# Altium project Turret_PCB.PrjPcb
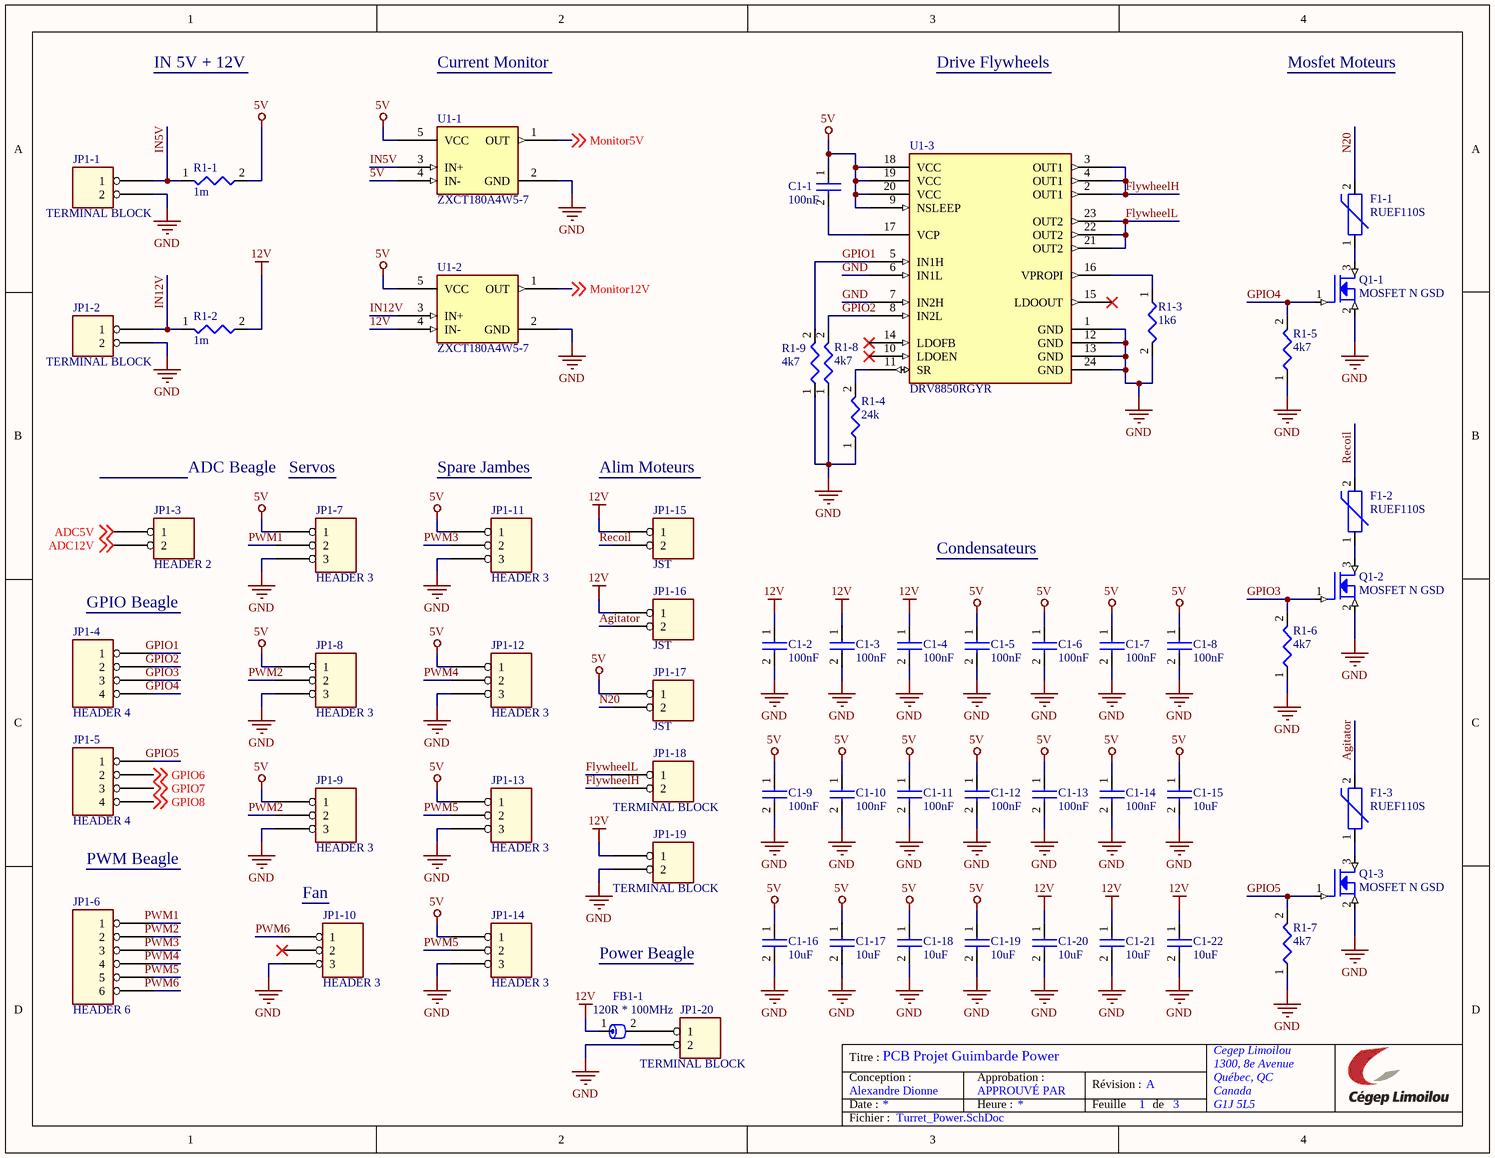
[diagram p0: Turret_Power.SchDoc]
NomDeProjet: Mon Projet; Revision: Rev.C
3 sheets, 100 parts. Net scope: global (net labels, ports and power ports of the same name join across sheets).
Board file: Turret.PcbDoc
Sheets:
  Turret_Power.SchDoc
  Turret_ADC_Protection.SchDoc
  Turret_Logic.SchDoc

## Sheet Turret_Power.SchDoc: PCB Projet Guimbarde Power
size Letter; ApprovedBy: APPROUVÉ PAR; Author: Alexandre Dionne; Organization: Cegep Limoilou; Address1: 1300, 8e Avenue; Address2: Québec, QC; Address3: Canada; Address4: G1J 5L5; Revision: A; SheetNumber: 1; SheetTotal: 3

### Parts
C1-1  100nF  [CAP_0603]
C1-2  100nF  [CAP_0603]
C1-3  100nF  [CAP_0603]
C1-4  100nF  [CAP_0603]
C1-5  100nF  [CAP_0603]
C1-6  100nF  [CAP_0603]
C1-7  100nF  [CAP_0603]
C1-8  100nF  [CAP_0603]
C1-9  100nF  [CAP_0603]
C1-10  100nF  [CAP_0603]
C1-11  100nF  [CAP_0603]
C1-12  100nF  [CAP_0603]
C1-13  100nF  [CAP_0603]
C1-14  100nF  [CAP_0603]
C1-15  10uF  [CAP_0603]
C1-16  10uF  [CAP_0603]
C1-17  10uF  [CAP_0603]
C1-18  10uF  [CAP_0603]
C1-19  10uF  [CAP_0603]
C1-20  10uF  [CAP_0603]
C1-21  10uF  [CAP_0603]
C1-22  10uF  [CAP_0603]
F1-1  RUEF110S  [MINISMDC110F/24-2]
F1-2  RUEF110S  [MINISMDC110F/24-2]
F1-3  RUEF110S  [MINISMDC110F/24-2]
FB1-1  120R * 100MHz  [MFBM1V3216-121-R]
JP1-1  TERMINAL BLOCK  [TB005-762-02BE]
JP1-2  TERMINAL BLOCK  [TB005-762-02BE]
JP1-3  HEADER 2  [Header_2]
JP1-4  HEADER 4  [Header_4]
JP1-5  HEADER 4  [Header_4]
JP1-6  HEADER 6  [Header_6]
JP1-7  HEADER 3  [Header_3]
JP1-8  HEADER 3  [Header_3]
JP1-9  HEADER 3  [Header_3]
JP1-10  HEADER 3  [Header_3]
JP1-11  HEADER 3  [Header_3]
JP1-12  HEADER 3  [Header_3]
JP1-13  HEADER 3  [Header_3]
JP1-14  HEADER 3  [Header_3]
JP1-15  JST  [B2B-PH-K-S]
JP1-16  JST  [B2B-PH-K-S]
JP1-17  JST  [B2B-PH-K-S]
JP1-18  TERMINAL BLOCK  [TB005-762-02BE]
JP1-19  TERMINAL BLOCK  [TB005-762-02BE]
JP1-20  TERMINAL BLOCK  [TB005-762-02BE]
Q1-1  MOSFET N GSD  [GSFC2312]
Q1-2  MOSFET N GSD  [GSFC2312]
Q1-3  MOSFET N GSD  [GSFC2312]
R1-1  1m  [RES_1206]
R1-2  1m  [RES_1206]
R1-3  1k6  [RES_0603]
R1-4  24k  [RES_0603]
R1-5  4k7  [RES_0603]
R1-6  4k7  [RES_0603]
R1-7  4k7  [RES_0603]
R1-8  4k7  [RES_0603]
R1-9  4k7  [RES_0603]
U1-1  ZXCT180A4W5-7  [ZXCT180A4W5-7]
U1-2  ZXCT180A4W5-7  [ZXCT180A4W5-7]
U1-3  DRV8850RGYR  [DRV8850]

### Nets
5V: C1-1.1 C1-5.1 C1-6.1 C1-7.1 C1-8.1 C1-9.1 C1-10.1 C1-11.1 C1-12.1 C1-13.1 C1-14.1 C1-15.1 C1-16.1 C1-17.1 C1-18.1 C1-19.1 JP1-7.1 JP1-8.1 JP1-9.1 JP1-11.1 JP1-12.1 JP1-13.1 JP1-14.1 JP1-17.1 R1-1.2 U1-1.4(IN-) U1-1.5(VCC) U1-2.5(VCC) U1-3.9(NSLEEP) U1-3.18(VCC) U1-3.19(VCC) U1-3.20(VCC)
12V: C1-2.1 C1-3.1 C1-4.1 C1-20.1 C1-21.1 C1-22.1 FB1-1.1 JP1-15.1 JP1-16.1 JP1-19.1 R1-2.2 U1-2.4(IN-)
GND: C1-2.2 C1-3.2 C1-4.2 C1-5.2 C1-6.2 C1-7.2 C1-8.2 C1-9.2 C1-10.2 C1-11.2 C1-12.2 C1-13.2 C1-14.2 C1-15.2 C1-16.2 C1-17.2 C1-18.2 C1-19.2 C1-20.2 C1-21.2 C1-22.2 JP1-1.2 JP1-2.2 JP1-7.3 JP1-8.3 JP1-9.3 JP1-10.3 JP1-11.3 JP1-12.3 JP1-13.3 JP1-14.3 JP1-19.2 JP1-20.2 Q1-1.2(SOURCE) Q1-2.2(SOURCE) Q1-3.2(SOURCE) R1-3.2 R1-4.1 R1-5.1 R1-6.1 R1-7.1 R1-8.1 R1-9.1 U1-1.2(GND) U1-2.2(GND) U1-3.1(GND) U1-3.6(IN1L) U1-3.7(IN2H) U1-3.12(GND) U1-3.13(GND) U1-3.24(GND)
ADC5V: JP1-3.1 ; off-sheet ADC5V
ADC12V: JP1-3.2 ; off-sheet ADC12V
Agitator: F1-3.2 JP1-16.2
FlywheelH: JP1-18.2 U1-3.2(OUT1) U1-3.3(OUT1) U1-3.4(OUT1)
FlywheelL: JP1-18.1 U1-3.21(OUT2) U1-3.22(OUT2) U1-3.23(OUT2)
GPIO1: JP1-4.1 R1-9.2 U1-3.5(IN1H)
GPIO2: JP1-4.2 R1-8.2 U1-3.8(IN2L)
GPIO3: JP1-4.3 Q1-2.1(GATE) R1-6.2
GPIO4: JP1-4.4 Q1-1.1(GATE) R1-5.2
GPIO5: JP1-5.1 Q1-3.1(GATE) R1-7.2
GPIO6: JP1-5.2 ; off-sheet GPIO6
GPIO7: JP1-5.3 ; off-sheet GPIO7
GPIO8: JP1-5.4 ; off-sheet GPIO8
IN5V: JP1-1.1 R1-1.1 U1-1.3(IN+)
IN12V: JP1-2.1 R1-2.1 U1-2.3(IN+)
Monitor5V: U1-1.1(OUT) ; off-sheet Monitor5V
Monitor12V: U1-2.1(OUT) ; off-sheet Monitor12V
N20: F1-1.2 JP1-17.2
PWM1: JP1-6.1 JP1-7.2
PWM2: JP1-6.2 JP1-8.2 JP1-9.2
PWM3: JP1-6.3 JP1-11.2
PWM4: JP1-6.4 JP1-12.2
PWM5: JP1-6.5 JP1-13.2 JP1-14.2
PWM6: JP1-6.6 JP1-10.1
Recoil: F1-2.2 JP1-15.2
NetC1-1_2: C1-1.2 U1-3.17(VCP)
NetF1-1_1: F1-1.1 Q1-1.3(DRAIN)
NetF1-2_1: F1-2.1 Q1-2.3(DRAIN)
NetF1-3_1: F1-3.1 Q1-3.3(DRAIN)
NetFB1-1_2: FB1-1.2 JP1-20.1
NetR1-3_1: R1-3.1 U1-3.16(VPROPI)
NetR1-4_2: R1-4.2 U1-3.11(SR)

Not connected (* = marked no-connect by the designer): JP1-10 2*; U1-3 10(LDOEN)* 14(LDOFB)* 15(LDOOUT)*

### Notes on the sheet
- IN 5V + 12V
- Current Monitor
- Drive Flywheels
- Mosfet Moteurs
- ADC Beagle
- Servos
- Spare Jambes
- Alim Moteurs
- Condensateurs
- GPIO Beagle
- PWM Beagle
- (near JP1-10) Fan
- Power Beagle
- Titre :
- Conception :
- Date :
- Approbation :
- Heure :
- Révision :
- Feuille
- de
- Fichier :

### Library data of the parts
C1-1-C1-22 = CAP NP
F1-1-F1-3 = Polyswitch
FB1-1 = Ferrite
JP1-1 JP1-2 JP1-15-JP1-20 = HEADER 2
R1-1-R1-9 = R
U1-3 = DRV8850RGYR: No Description Available; Mfr_Name: Texas Instruments; RefDes: RefDes; Type: Type

## Sheet Turret_ADC_Protection.SchDoc: Protection ADC
size Letter; ApprovedBy: APPROUVÉ PAR; Author: Alexandre Dionne; Organization: Cegep Limoilou; Address1: 1300, 8e Avenue; Address2: Québec, QC; Address3: Canada; Address4: G1J 5L5; Revision: A; SheetNumber: 2; SheetTotal: 3
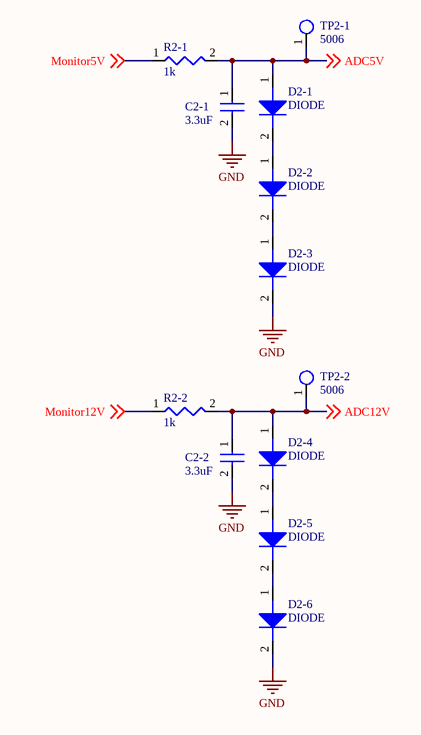
[diagram p1: Turret_ADC_Protection.SchDoc]

### Parts
C2-1  3.3uF  [CAP_0603]
C2-2  3.3uF  [CAP_0603]
D2-1  DIODE  [CD214A-B160R]
D2-2  DIODE  [CD214A-B160R]
D2-3  DIODE  [CD214A-B160R]
D2-4  DIODE  [CD214A-B160R]
D2-5  DIODE  [CD214A-B160R]
D2-6  DIODE  [CD214A-B160R]
R2-1  1k  [RES_0603]
R2-2  1k  [RES_0603]
TP2-1  5006  [TestPoint]
TP2-2  5006  [TestPoint]

### Nets
GND: C2-1.2 C2-2.2 D2-3.2(CATHODE) D2-6.2(CATHODE)
ADC5V: C2-1.1 D2-1.1(ANODE) R2-1.2 TP2-1.1 ; off-sheet ADC5V
ADC12V: C2-2.1 D2-4.1(ANODE) R2-2.2 TP2-2.1 ; off-sheet ADC12V
Monitor5V: R2-1.1 ; off-sheet Monitor5V
Monitor12V: R2-2.1 ; off-sheet Monitor12V
NetD2-1_2: D2-1.2(CATHODE) D2-2.1(ANODE)
NetD2-2_2: D2-2.2(CATHODE) D2-3.1(ANODE)
NetD2-4_2: D2-4.2(CATHODE) D2-5.1(ANODE)
NetD2-5_2: D2-5.2(CATHODE) D2-6.1(ANODE)

### Notes on the sheet
- Titre :
- Conception :
- Date :
- Approbation :
- Heure :
- Révision :
- Feuille
- de
- Fichier :

### Library data of the parts
C2-1 C2-2 = CAP NP
R2-1 R2-2 = R
TP2-1 TP2-2 = Test_Point

## Sheet Turret_Logic.SchDoc: PCB Projet Guimbarde Logic
size Letter; ApprovedBy: APPROUVÉ PAR; Author: Alexandre Dionne; Organization: Cegep Limoilou; Address1: 1300, 8e Avenue; Address2: Québec, QC; Address3: Canada; Address4: G1J 5L5; Revision: A; SheetNumber: 3; SheetTotal: 3
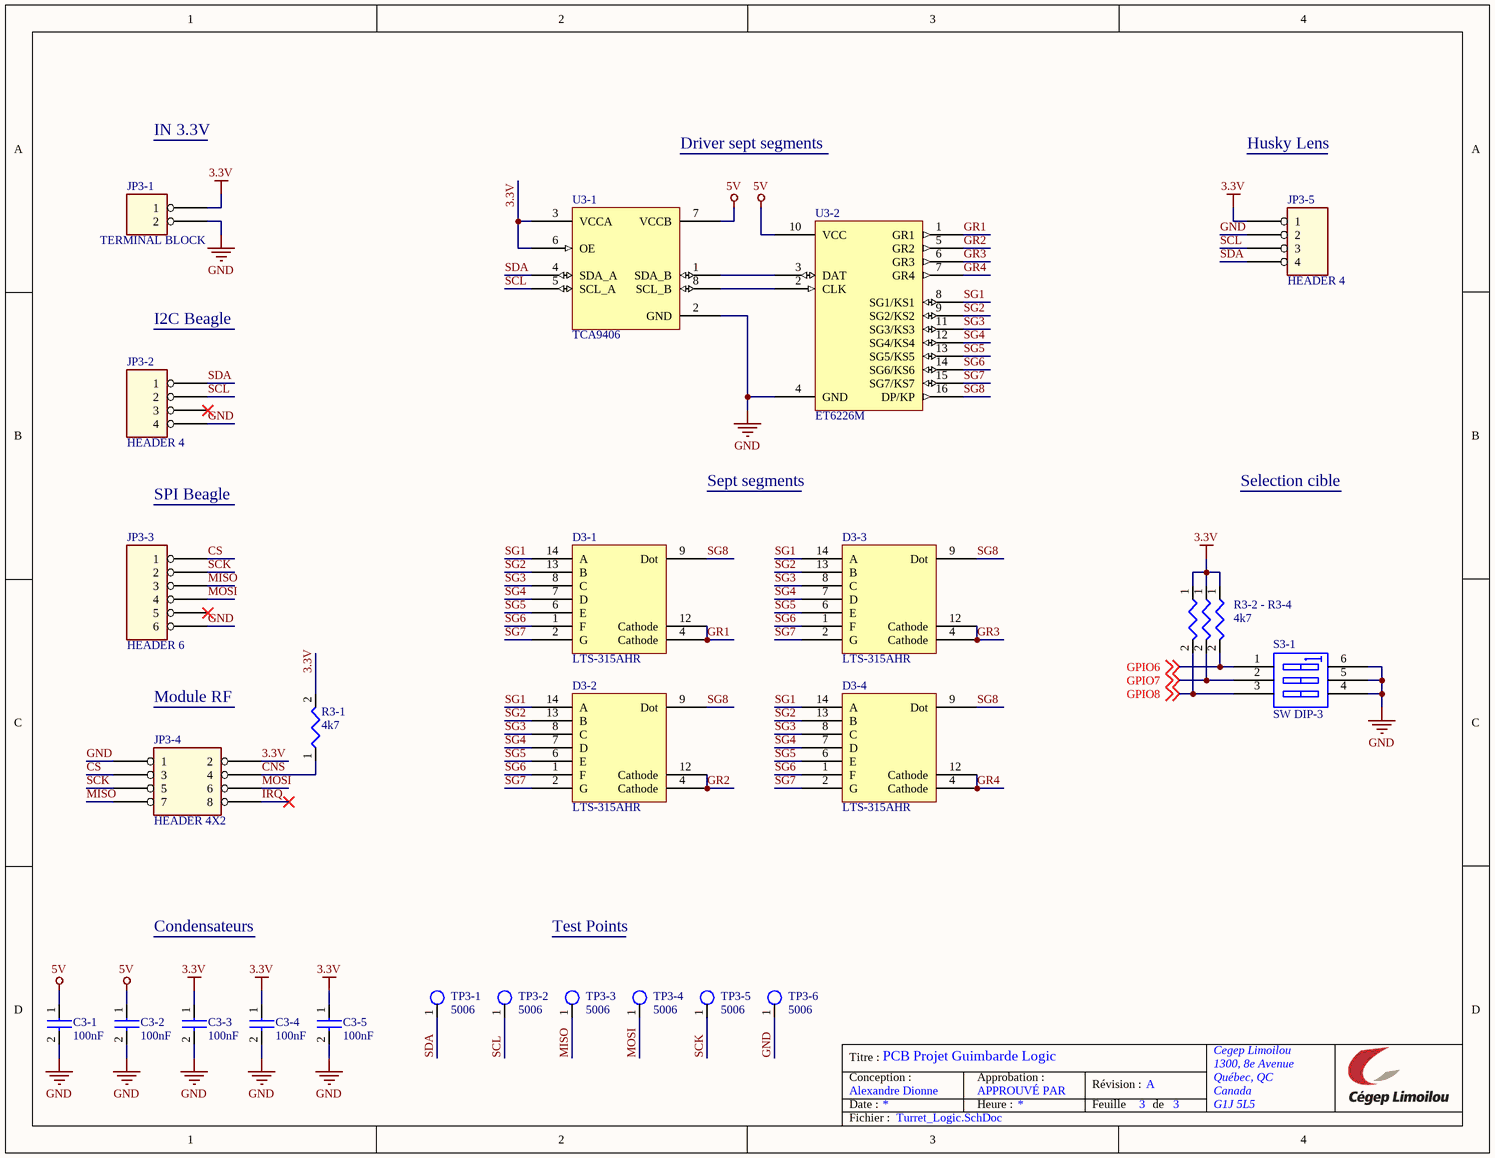
[diagram p2: Turret_Logic.SchDoc]

### Parts
C3-1  100nF  [CAP_0603]
C3-2  100nF  [CAP_0603]
C3-3  100nF  [CAP_0603]
C3-4  100nF  [CAP_0603]
C3-5  100nF  [CAP_0603]
D3-1  LTS-315AHR  [LTS-315AHR]
D3-2  LTS-315AHR  [LTS-315AHR]
D3-3  LTS-315AHR  [LTS-315AHR]
D3-4  LTS-315AHR  [LTS-315AHR]
JP3-1  TERMINAL BLOCK  [TB005-762-02BE]
JP3-2  HEADER 4  [Header_4]
JP3-3  HEADER 6  [Header_6]
JP3-4  HEADER 4X2  [Header_2x4]
JP3-5  HEADER 4  [Header_4]
R3-1  4k7  [RES_0603]
R3-2  4k7  [RES_0603]  (value not drawn)
R3-3  4k7  [RES_0603]  (value not drawn)
R3-4  4k7  [RES_0603]  (value not drawn)
S3-1  SW DIP-3  [219-3LPST]
TP3-1  5006  [TestPoint]
TP3-2  5006  [TestPoint]
TP3-3  5006  [TestPoint]
TP3-4  5006  [TestPoint]
TP3-5  5006  [TestPoint]
TP3-6  5006  [TestPoint]
U3-1  TCA9406  [TCA9406]
U3-2  ET6226M  [ET6226M]

### Nets
3.3V: C3-3.1 C3-4.1 C3-5.1 JP3-1.1 JP3-4.2 JP3-5.1 R3-1.2 R3-2.1 R3-3.1 R3-4.1 U3-1.3(VCCA) U3-1.6(OE)
5V: C3-1.1 C3-2.1 U3-1.7(VCCB) U3-2.10(VCC)
GND: C3-1.2 C3-2.2 C3-3.2 C3-4.2 C3-5.2 JP3-1.2 JP3-2.4 JP3-3.6 JP3-4.1 JP3-5.2 S3-1.4(B3) S3-1.5(B2) S3-1.6(B1) TP3-6.1 U3-1.2(GND) U3-2.4(GND)
CNS: JP3-4.4 R3-1.1
CS: JP3-3.1 JP3-4.3
GPIO6: R3-4.2 S3-1.1(A1) ; off-sheet GPIO6
GPIO7: R3-3.2 S3-1.2(A2) ; off-sheet GPIO7
GPIO8: R3-2.2 S3-1.3(A3) ; off-sheet GPIO8
GR1: D3-1.4(Cathode) D3-1.12(Cathode) U3-2.1(GR1)
GR2: D3-2.4(Cathode) D3-2.12(Cathode) U3-2.5(GR2)
GR3: D3-3.4(Cathode) D3-3.12(Cathode) U3-2.6(GR3)
GR4: D3-4.4(Cathode) D3-4.12(Cathode) U3-2.7(GR4)
IRQ: JP3-4.8
MISO: JP3-3.3 JP3-4.7 TP3-3.1
MOSI: JP3-3.4 JP3-4.6 TP3-4.1
SCK: JP3-3.2 JP3-4.5 TP3-5.1
SCL: JP3-2.2 JP3-5.3 TP3-2.1 U3-1.5(SCL_A)
SDA: JP3-2.1 JP3-5.4 TP3-1.1 U3-1.4(SDA_A)
SG1: D3-1.14(A) D3-2.14(A) D3-3.14(A) D3-4.14(A) U3-2.8(SG1/KS1)
SG2: D3-1.13(B) D3-2.13(B) D3-3.13(B) D3-4.13(B) U3-2.9(SG2/KS2)
SG3: D3-1.8(C) D3-2.8(C) D3-3.8(C) D3-4.8(C) U3-2.11(SG3/KS3)
SG4: D3-1.7(D) D3-2.7(D) D3-3.7(D) D3-4.7(D) U3-2.12(SG4/KS4)
SG5: D3-1.6(E) D3-2.6(E) D3-3.6(E) D3-4.6(E) U3-2.13(SG5/KS5)
SG6: D3-1.1(F) D3-2.1(F) D3-3.1(F) D3-4.1(F) U3-2.14(SG6/KS6)
SG7: D3-1.2(G) D3-2.2(G) D3-3.2(G) D3-4.2(G) U3-2.15(SG7/KS7)
SG8: D3-1.9(Dot) D3-2.9(Dot) D3-3.9(Dot) D3-4.9(Dot) U3-2.16(DP/KP)
NetU3-1_1: U3-1.1(SDA_B) U3-2.3(DAT)
NetU3-1_8: U3-1.8(SCL_B) U3-2.2(CLK)

Not connected (* = marked no-connect by the designer): JP3-2 3*; JP3-3 5*

### Notes on the sheet
- IN 3.3V
- Driver sept segments
- Husky Lens
- I2C Beagle
- SPI Beagle
- Sept segments
- Selection cible
- (near R3-4) 4k7
- (near R3-4) R3-2 - R3-4
- Module RF
- Condensateurs
- Test Points
- Titre :
- Conception :
- Date :
- Approbation :
- Heure :
- Révision :
- Feuille
- de
- Fichier :

### Library data of the parts
C3-1-C3-5 = CAP NP
JP3-1 = HEADER 2
R3-1-R3-4 = R
TP3-1-TP3-6 = Test_Point

## Nets that join several sheets
5V: Turret_Power (32 pins), Turret_Logic (C3-1.1 C3-2.1 U3-1.7 U3-2.10)
GND: Turret_Power (51 pins), Turret_ADC_Protection (C2-1.2 C2-2.2 D2-3.2 D2-6.2), Turret_Logic (16 pins)
ADC5V: Turret_Power (JP1-3.1), Turret_ADC_Protection (C2-1.1 D2-1.1 R2-1.2 TP2-1.1)
ADC12V: Turret_Power (JP1-3.2), Turret_ADC_Protection (C2-2.1 D2-4.1 R2-2.2 TP2-2.1)
GPIO6: Turret_Power (JP1-5.2), Turret_Logic (R3-4.2 S3-1.1)
GPIO7: Turret_Power (JP1-5.3), Turret_Logic (R3-3.2 S3-1.2)
GPIO8: Turret_Power (JP1-5.4), Turret_Logic (R3-2.2 S3-1.3)
Monitor5V: Turret_Power (U1-1.1), Turret_ADC_Protection (R2-1.1)
Monitor12V: Turret_Power (U1-2.1), Turret_ADC_Protection (R2-2.1)